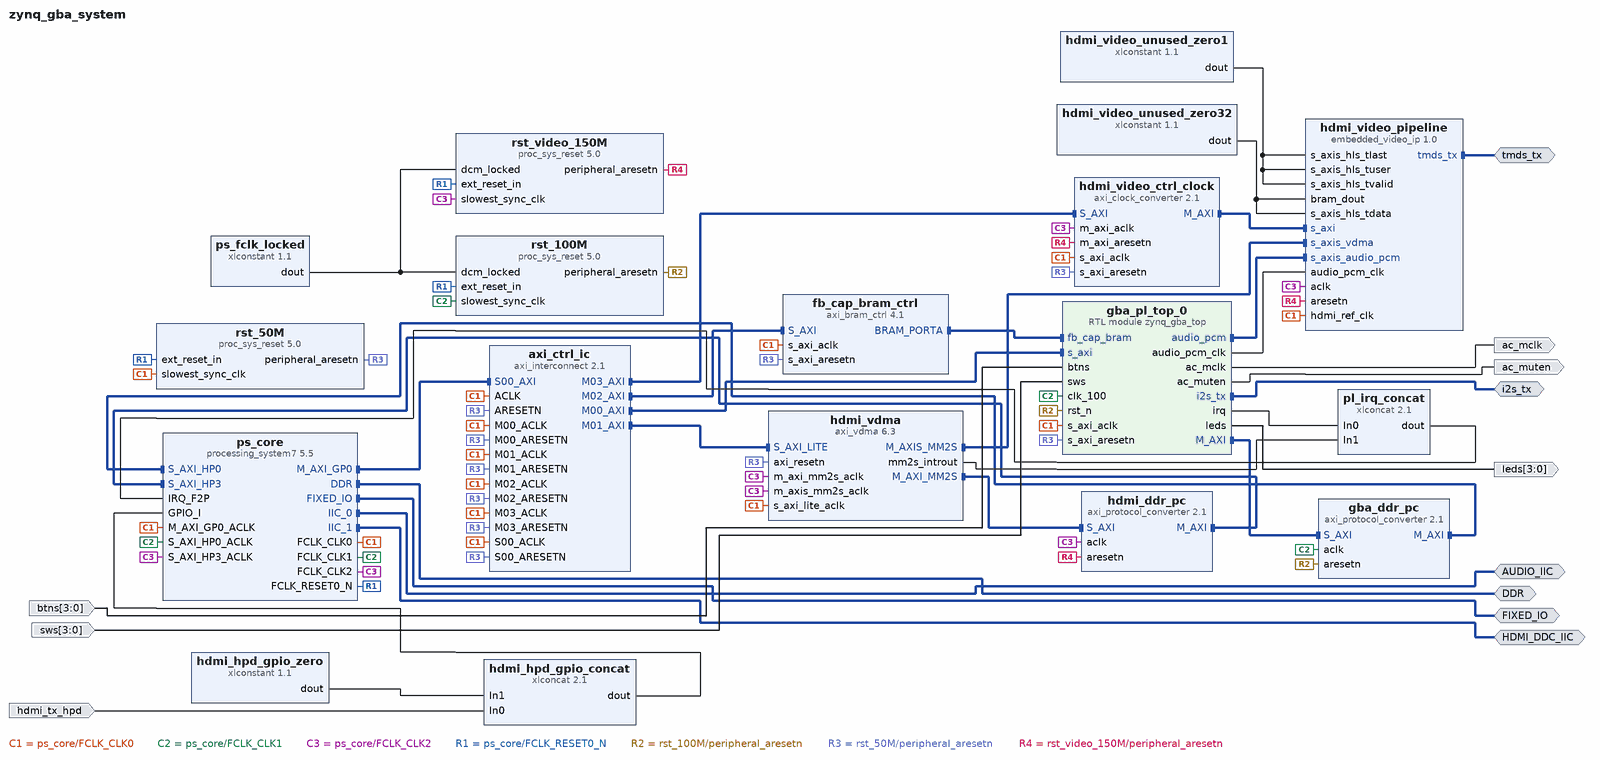
[diagram p0: block diagram of the top level]
# Vivado block design zynq_gba_system, xc7z020clg400-1, Vivado 2025.2.1
create_bd_design zynq_gba_system

create_bd_intf_port -mode Master -vlnv xilinx.com:interface:ddrx_rtl:1.0 DDR
create_bd_intf_port -mode Master -vlnv xilinx.com:display_processing_system7:fixedio_rtl:1.0 FIXED_IO
create_bd_intf_port -mode Master -vlnv xilinx.com:interface:iic_rtl:1.0 AUDIO_IIC
create_bd_intf_port -mode Master -vlnv xilinx.com:interface:iic_rtl:1.0 HDMI_DDC_IIC
create_bd_intf_port -mode Master -vlnv xilinx.com:interface:i2s_rtl:1.0 i2s_tx
create_bd_intf_port -mode Master -vlnv panfpga.org:interface:tmds_rtl:1.0 tmds_tx
create_bd_port -dir O ac_mclk
create_bd_port -dir O ac_muten
create_bd_port -dir I -from 3 -to 0 btns
create_bd_port -dir I -from 3 -to 0 sws
create_bd_port -dir O -from 3 -to 0 leds
create_bd_port -dir I hdmi_tx_hpd

create_bd_cell -type ip -vlnv xilinx.com:ip:processing_system7:5.5 ps_core
set_property -dict [list \
  CONFIG.PCW_APU_PERIPHERAL_FREQMHZ 666.666667 \
  CONFIG.PCW_ENET0_PERIPHERAL_ENABLE 0 \
  CONFIG.PCW_EN_CLK1_PORT 1 \
  CONFIG.PCW_EN_CLK2_PORT 1 \
  CONFIG.PCW_FCLK_CLK1_BUF TRUE \
  CONFIG.PCW_FCLK_CLK2_BUF TRUE \
  CONFIG.PCW_FPGA0_PERIPHERAL_FREQMHZ 50 \
  CONFIG.PCW_FPGA1_PERIPHERAL_FREQMHZ 100 \
  CONFIG.PCW_FPGA2_PERIPHERAL_FREQMHZ 150 \
  CONFIG.PCW_FPGA_FCLK1_ENABLE 1 \
  CONFIG.PCW_FPGA_FCLK2_ENABLE 1 \
  CONFIG.PCW_GPIO_EMIO_GPIO_ENABLE 1 \
  CONFIG.PCW_GPIO_EMIO_GPIO_IO EMIO \
  CONFIG.PCW_GPIO_MIO_GPIO_ENABLE 1 \
  CONFIG.PCW_GPIO_MIO_GPIO_IO MIO \
  CONFIG.PCW_GPIO_PERIPHERAL_ENABLE 1 \
  CONFIG.PCW_I2C0_I2C0_IO EMIO \
  CONFIG.PCW_I2C0_PERIPHERAL_ENABLE 1 \
  CONFIG.PCW_I2C1_I2C1_IO EMIO \
  CONFIG.PCW_I2C1_PERIPHERAL_ENABLE 1 \
  CONFIG.PCW_I2C_PERIPHERAL_FREQMHZ 111.111115 \
  CONFIG.PCW_I2C_RESET_ENABLE 0 \
  CONFIG.PCW_IRQ_F2P_INTR 1 \
  CONFIG.PCW_PERIPHERAL_BOARD_PRESET part0 \
  CONFIG.PCW_PRESET_BANK1_VOLTAGE {LVCMOS 1.8V} \
  CONFIG.PCW_QSPI_GRP_FBCLK_ENABLE 1 \
  CONFIG.PCW_QSPI_GRP_FBCLK_IO {MIO 8} \
  CONFIG.PCW_QSPI_GRP_SINGLE_SS_ENABLE 1 \
  CONFIG.PCW_QSPI_GRP_SINGLE_SS_IO {MIO 1 .. 6} \
  CONFIG.PCW_QSPI_PERIPHERAL_ENABLE 1 \
  CONFIG.PCW_QSPI_QSPI_IO {MIO 1 .. 6} \
  CONFIG.PCW_SD0_GRP_CD_ENABLE 1 \
  CONFIG.PCW_SD0_GRP_CD_IO {MIO 47} \
  CONFIG.PCW_SD0_GRP_WP_ENABLE 0 \
  CONFIG.PCW_SD0_PERIPHERAL_ENABLE 1 \
  CONFIG.PCW_SD0_SD0_IO {MIO 40 .. 45} \
  CONFIG.PCW_SDIO_PERIPHERAL_FREQMHZ 100 \
  CONFIG.PCW_SINGLE_QSPI_DATA_MODE x4 \
  CONFIG.PCW_TTC0_PERIPHERAL_ENABLE 1 \
  CONFIG.PCW_TTC0_TTC0_IO EMIO \
  CONFIG.PCW_TTC1_PERIPHERAL_ENABLE 1 \
  CONFIG.PCW_TTC1_TTC1_IO EMIO \
  CONFIG.PCW_UART1_PERIPHERAL_ENABLE 1 \
  CONFIG.PCW_UART1_UART1_IO {MIO 48 .. 49} \
  CONFIG.PCW_UART_PERIPHERAL_FREQMHZ 100 \
  CONFIG.PCW_UIPARAM_DDR_FREQ_MHZ 533.333333 \
  CONFIG.PCW_UIPARAM_DDR_PARTNO {MT41K256M16 RE-125} \
  CONFIG.PCW_USB0_PERIPHERAL_ENABLE 1 \
  CONFIG.PCW_USB0_RESET_ENABLE 1 \
  CONFIG.PCW_USB0_RESET_IO {MIO 46} \
  CONFIG.PCW_USB0_USB0_IO {MIO 28 .. 39} \
  CONFIG.PCW_USB_RESET_ENABLE 1 \
  CONFIG.PCW_USB_RESET_SELECT {Share reset pin} \
  CONFIG.PCW_USE_FABRIC_INTERRUPT 1 \
  CONFIG.PCW_USE_S_AXI_HP0 1 \
  CONFIG.PCW_USE_S_AXI_HP3 1 \
  CONFIG.preset None \
] [get_bd_cells ps_core]
# 510 more settings of ps_core are not shown: defaults, MIO pin electricals, DDR timing, and values the tool derives
create_bd_cell -type ip -vlnv xilinx.com:ip:axi_interconnect:2.1 axi_ctrl_ic
set_property -dict {CONFIG.NUM_MI 4} [get_bd_cells axi_ctrl_ic]
create_bd_cell -type ip -vlnv xilinx.com:ip:axi_protocol_converter:2.1 gba_ddr_pc
set_property -dict {CONFIG.MI_PROTOCOL AXI3} [get_bd_cells gba_ddr_pc]
create_bd_cell -type ip -vlnv xilinx.com:ip:axi_protocol_converter:2.1 hdmi_ddr_pc
set_property -dict {CONFIG.MI_PROTOCOL AXI3} [get_bd_cells hdmi_ddr_pc]
create_bd_cell -type ip -vlnv xilinx.com:ip:proc_sys_reset:5.0 rst_50M
create_bd_cell -type ip -vlnv xilinx.com:ip:proc_sys_reset:5.0 rst_100M
create_bd_cell -type module -reference zynq_gba_top gba_pl_top_0
create_bd_cell -type ip -vlnv xilinx.com:ip:axi_vdma:6.3 hdmi_vdma
set_property -dict {CONFIG.c_include_s2mm 0} [get_bd_cells hdmi_vdma]
create_bd_cell -type ip -vlnv xilinx.com:ip:xlconcat:2.1 pl_irq_concat
set_property -dict {CONFIG.NUM_PORTS 2} [get_bd_cells pl_irq_concat]
create_bd_cell -type ip -vlnv xilinx.com:ip:axi_bram_ctrl:4.1 fb_cap_bram_ctrl
set_property -dict {CONFIG.DATA_WIDTH 32 CONFIG.SINGLE_PORT_BRAM 1} [get_bd_cells fb_cap_bram_ctrl]
create_bd_cell -type ip -vlnv xilinx.com:ip:xlconcat:2.1 hdmi_hpd_gpio_concat
set_property -dict {CONFIG.IN0_WIDTH 1 CONFIG.IN1_WIDTH 63 CONFIG.NUM_PORTS 2} [get_bd_cells hdmi_hpd_gpio_concat]
create_bd_cell -type ip -vlnv xilinx.com:ip:xlconstant:1.1 hdmi_hpd_gpio_zero
set_property -dict {CONFIG.CONST_VAL 0 CONFIG.CONST_WIDTH 63} [get_bd_cells hdmi_hpd_gpio_zero]
create_bd_cell -type ip -vlnv panfpga.org:video:embedded_video_ip:1.0 hdmi_video_pipeline
set_property -dict [list \
  CONFIG.AXI_ADDR_WIDTH 6 \
  CONFIG.BRAM_ADDR_WIDTH 18 \
  CONFIG.ENABLE_BRAM_SOURCE 0 \
  CONFIG.ENABLE_HDMI_AUDIO 1 \
  CONFIG.ENABLE_HLS_SOURCE 0 \
  CONFIG.ENABLE_SCALER 1 \
  CONFIG.ENABLE_VDMA_SOURCE 1 \
  CONFIG.FIXED_FORMAT 2 \
  CONFIG.FIXED_SOURCE 2 \
  CONFIG.FORMAT_SELECT_MODE 1 \
  CONFIG.LINE_BUFFER_IMPLEMENTATION 1 \
  CONFIG.MAX_INPUT_HEIGHT 1080 \
  CONFIG.MAX_INPUT_WIDTH 1920 \
  CONFIG.MAX_SCALER_INPUT_HEIGHT 160 \
  CONFIG.MAX_SCALER_INPUT_WIDTH 240 \
  CONFIG.SOURCE_SELECT_MODE 1 \
] [get_bd_cells hdmi_video_pipeline]
create_bd_cell -type ip -vlnv xilinx.com:ip:xlconstant:1.1 hdmi_video_unused_zero32
set_property -dict {CONFIG.CONST_VAL 0 CONFIG.CONST_WIDTH 32} [get_bd_cells hdmi_video_unused_zero32]
create_bd_cell -type ip -vlnv xilinx.com:ip:xlconstant:1.1 hdmi_video_unused_zero1
set_property -dict {CONFIG.CONST_VAL 0 CONFIG.CONST_WIDTH 1} [get_bd_cells hdmi_video_unused_zero1]
create_bd_cell -type ip -vlnv xilinx.com:ip:axi_clock_converter:2.1 hdmi_video_ctrl_clock
set_property -dict [list \
  CONFIG.ACLK_ASYNC 1 \
  CONFIG.ADDR_WIDTH 32 \
  CONFIG.DATA_WIDTH 32 \
  CONFIG.PROTOCOL AXI4LITE \
] [get_bd_cells hdmi_video_ctrl_clock]
create_bd_cell -type ip -vlnv xilinx.com:ip:proc_sys_reset:5.0 rst_video_150M
create_bd_cell -type ip -vlnv xilinx.com:ip:xlconstant:1.1 ps_fclk_locked
set_property -dict {CONFIG.CONST_VAL 1 CONFIG.CONST_WIDTH 1} [get_bd_cells ps_fclk_locked]

# ---- connections ----

connect_bd_intf_net [get_bd_intf_pins axi_ctrl_ic/M00_AXI] [get_bd_intf_pins gba_pl_top_0/s_axi]
connect_bd_intf_net [get_bd_intf_pins axi_ctrl_ic/M01_AXI] [get_bd_intf_pins hdmi_vdma/S_AXI_LITE]
connect_bd_intf_net [get_bd_intf_pins axi_ctrl_ic/M02_AXI] [get_bd_intf_pins fb_cap_bram_ctrl/S_AXI]
connect_bd_intf_net [get_bd_intf_pins axi_ctrl_ic/M03_AXI] [get_bd_intf_pins hdmi_video_ctrl_clock/S_AXI]
connect_bd_intf_net [get_bd_intf_pins fb_cap_bram_ctrl/BRAM_PORTA] [get_bd_intf_pins gba_pl_top_0/fb_cap_bram]
connect_bd_intf_net [get_bd_intf_pins gba_ddr_pc/M_AXI] [get_bd_intf_pins ps_core/S_AXI_HP0]
connect_bd_intf_net [get_bd_intf_pins gba_pl_top_0/M_AXI] [get_bd_intf_pins gba_ddr_pc/S_AXI]
connect_bd_intf_net [get_bd_intf_pins gba_pl_top_0/audio_pcm] [get_bd_intf_pins hdmi_video_pipeline/s_axis_audio_pcm]
connect_bd_intf_net [get_bd_intf_pins gba_pl_top_0/i2s_tx] [get_bd_intf_ports i2s_tx]
connect_bd_intf_net [get_bd_intf_pins hdmi_ddr_pc/M_AXI] [get_bd_intf_pins ps_core/S_AXI_HP3]
connect_bd_intf_net [get_bd_intf_pins hdmi_vdma/M_AXIS_MM2S] [get_bd_intf_pins hdmi_video_pipeline/s_axis_vdma]
connect_bd_intf_net [get_bd_intf_pins hdmi_vdma/M_AXI_MM2S] [get_bd_intf_pins hdmi_ddr_pc/S_AXI]
connect_bd_intf_net [get_bd_intf_pins hdmi_video_ctrl_clock/M_AXI] [get_bd_intf_pins hdmi_video_pipeline/s_axi]
connect_bd_intf_net [get_bd_intf_pins hdmi_video_pipeline/tmds_tx] [get_bd_intf_ports tmds_tx]
connect_bd_intf_net [get_bd_intf_pins ps_core/DDR] [get_bd_intf_ports DDR]
connect_bd_intf_net [get_bd_intf_pins ps_core/FIXED_IO] [get_bd_intf_ports FIXED_IO]
connect_bd_intf_net [get_bd_intf_pins ps_core/IIC_0] [get_bd_intf_ports AUDIO_IIC]
connect_bd_intf_net [get_bd_intf_pins ps_core/IIC_1] [get_bd_intf_ports HDMI_DDC_IIC]
connect_bd_intf_net [get_bd_intf_pins ps_core/M_AXI_GP0] [get_bd_intf_pins axi_ctrl_ic/S00_AXI]
connect_bd_net [get_bd_ports btns] [get_bd_pins gba_pl_top_0/btns]
connect_bd_net [get_bd_pins gba_pl_top_0/ac_mclk] [get_bd_ports ac_mclk]
connect_bd_net [get_bd_pins gba_pl_top_0/ac_muten] [get_bd_ports ac_muten]
connect_bd_net [get_bd_pins gba_pl_top_0/audio_pcm_clk] [get_bd_pins hdmi_video_pipeline/audio_pcm_clk]
connect_bd_net [get_bd_pins gba_pl_top_0/irq] [get_bd_pins pl_irq_concat/In0]
connect_bd_net -net hdmi_hpd_gpio_gpioi_net [get_bd_pins hdmi_hpd_gpio_concat/dout] [get_bd_pins ps_core/GPIO_I]
connect_bd_net -net hdmi_hpd_gpio_zero_net [get_bd_pins hdmi_hpd_gpio_zero/dout] [get_bd_pins hdmi_hpd_gpio_concat/In1]
connect_bd_net -net hdmi_tx_hpd_net [get_bd_ports hdmi_tx_hpd] [get_bd_pins hdmi_hpd_gpio_concat/In0]
connect_bd_net [get_bd_pins hdmi_vdma/mm2s_introut] [get_bd_pins pl_irq_concat/In1]
connect_bd_net [get_bd_pins hdmi_video_unused_zero1/dout] \
  [get_bd_pins hdmi_video_pipeline/s_axis_hls_tvalid] [get_bd_pins hdmi_video_pipeline/s_axis_hls_tuser] \
  [get_bd_pins hdmi_video_pipeline/s_axis_hls_tlast]
connect_bd_net [get_bd_pins hdmi_video_unused_zero32/dout] \
  [get_bd_pins hdmi_video_pipeline/s_axis_hls_tdata] [get_bd_pins hdmi_video_pipeline/bram_dout]
connect_bd_net -net leds_1 [get_bd_pins gba_pl_top_0/leds] [get_bd_ports leds]
connect_bd_net [get_bd_pins pl_irq_concat/dout] [get_bd_pins ps_core/IRQ_F2P]
connect_bd_net [get_bd_pins ps_core/FCLK_CLK0] \
  [get_bd_pins gba_pl_top_0/s_axi_aclk] [get_bd_pins axi_ctrl_ic/ACLK] [get_bd_pins axi_ctrl_ic/S00_ACLK] \
  [get_bd_pins axi_ctrl_ic/M00_ACLK] [get_bd_pins axi_ctrl_ic/M01_ACLK] [get_bd_pins hdmi_vdma/s_axi_lite_aclk] \
  [get_bd_pins ps_core/M_AXI_GP0_ACLK] [get_bd_pins rst_50M/slowest_sync_clk] [get_bd_pins axi_ctrl_ic/M03_ACLK] \
  [get_bd_pins hdmi_video_ctrl_clock/s_axi_aclk] [get_bd_pins axi_ctrl_ic/M02_ACLK] [get_bd_pins fb_cap_bram_ctrl/s_axi_aclk] \
  [get_bd_pins hdmi_video_pipeline/hdmi_ref_clk]
connect_bd_net [get_bd_pins ps_core/FCLK_CLK1] \
  [get_bd_pins gba_pl_top_0/clk_100] [get_bd_pins gba_ddr_pc/aclk] [get_bd_pins ps_core/S_AXI_HP0_ACLK] \
  [get_bd_pins rst_100M/slowest_sync_clk]
connect_bd_net [get_bd_pins ps_core/FCLK_CLK2] \
  [get_bd_pins hdmi_video_pipeline/aclk] [get_bd_pins hdmi_video_ctrl_clock/m_axi_aclk] \
  [get_bd_pins hdmi_vdma/m_axi_mm2s_aclk] [get_bd_pins hdmi_vdma/m_axis_mm2s_aclk] [get_bd_pins hdmi_ddr_pc/aclk] \
  [get_bd_pins ps_core/S_AXI_HP3_ACLK] [get_bd_pins rst_video_150M/slowest_sync_clk]
connect_bd_net [get_bd_pins ps_core/FCLK_RESET0_N] \
  [get_bd_pins rst_100M/ext_reset_in] [get_bd_pins rst_50M/ext_reset_in] [get_bd_pins rst_video_150M/ext_reset_in]
connect_bd_net [get_bd_pins ps_fclk_locked/dout] [get_bd_pins rst_100M/dcm_locked] [get_bd_pins rst_video_150M/dcm_locked]
connect_bd_net [get_bd_pins rst_100M/peripheral_aresetn] [get_bd_pins gba_pl_top_0/rst_n] [get_bd_pins gba_ddr_pc/aresetn]
connect_bd_net [get_bd_pins rst_50M/peripheral_aresetn] \
  [get_bd_pins gba_pl_top_0/s_axi_aresetn] [get_bd_pins axi_ctrl_ic/ARESETN] [get_bd_pins axi_ctrl_ic/S00_ARESETN] \
  [get_bd_pins axi_ctrl_ic/M00_ARESETN] [get_bd_pins axi_ctrl_ic/M01_ARESETN] [get_bd_pins hdmi_vdma/axi_resetn] \
  [get_bd_pins axi_ctrl_ic/M03_ARESETN] [get_bd_pins hdmi_video_ctrl_clock/s_axi_aresetn] \
  [get_bd_pins axi_ctrl_ic/M02_ARESETN] [get_bd_pins fb_cap_bram_ctrl/s_axi_aresetn]
connect_bd_net [get_bd_pins rst_video_150M/peripheral_aresetn] \
  [get_bd_pins hdmi_video_pipeline/aresetn] [get_bd_pins hdmi_video_ctrl_clock/m_axi_aresetn] \
  [get_bd_pins hdmi_ddr_pc/aresetn]
connect_bd_net [get_bd_ports sws] [get_bd_pins gba_pl_top_0/sws]

# ---- address map ----
assign_bd_address -offset 0x00000000 -range 1G -target_address_space [get_bd_addr_spaces gba_pl_top_0/M_AXI] [get_bd_addr_segs ps_core/S_AXI_HP0/HP0_DDR_LOWOCM]
assign_bd_address -offset 0x00000000 -range 1G -target_address_space [get_bd_addr_spaces hdmi_vdma/Data_MM2S] [get_bd_addr_segs ps_core/S_AXI_HP3/HP3_DDR_LOWOCM]
assign_bd_address -offset 0x40000000 -range 4K -target_address_space [get_bd_addr_spaces ps_core/Data] [get_bd_addr_segs gba_pl_top_0/s_axi/reg0]
assign_bd_address -offset 0x43000000 -range 64K -target_address_space [get_bd_addr_spaces ps_core/Data] [get_bd_addr_segs hdmi_vdma/S_AXI_LITE/Reg]
assign_bd_address -offset 0x43010000 -range 4K -target_address_space [get_bd_addr_spaces ps_core/Data] [get_bd_addr_segs hdmi_video_pipeline/s_axi/reg0]
assign_bd_address -offset 0x44000000 -range 256K -target_address_space [get_bd_addr_spaces ps_core/Data] [get_bd_addr_segs fb_cap_bram_ctrl/S_AXI/Mem0]

validate_bd_design
save_bd_design
